# Altium schematic sheet 01_ECG_Input_AFE.SchDoc
size A; SheetNumber: 6; SheetTotal: 6
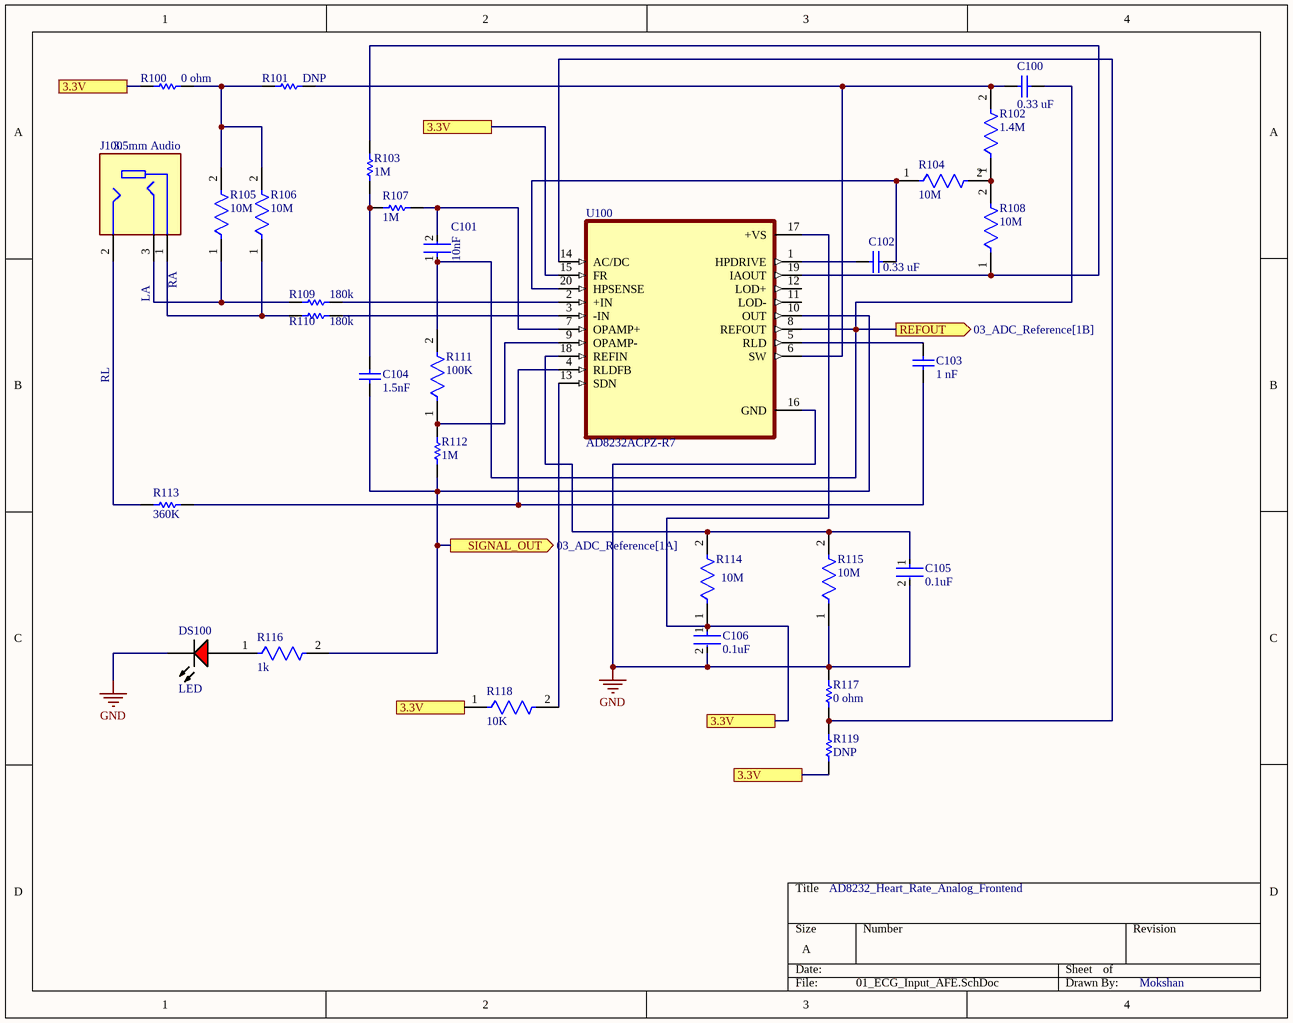
[diagram p0: 01_ECG_Input_AFE.SchDoc]

## Parts
C100  0.33 uF  [CAPC2013X135X45ML10T25]
C101  10nF  [FP-0805-L_2_01_0_2-W_1_25-IPC_A]
C102  0.33 uF  [CAPC2013X135X45ML10T25]
C103  1 nF  [CAPC0805(2012)100_M]
C104  1.5nF  [CAPC2013X140X50ML20T25]
C105  0.1uF  [FP-CC0805-0_85-MFG]
C106  0.1uF  [FP-CC0805-0_85-MFG]
DS100  LED  [LUMX-SML-LX1206IC_V]
J100  3.5mm Audio  [CUI_SJ1-3523N]
R100  0 ohm  [RESC1608X55X25ML10T15]
R101  DNP  [RESC1608X55X25ML10T15]
R102  1.4M  [FP-ESR10-MFG]
R103  1M  [RESC0805(2012)_L]
R104  10M  [FP-CRCW0805-e3-IPC_C]
R105  10M  [FP-CRCW0805-e3-IPC_C]
R106  10M  [FP-CRCW0805-e3-IPC_C]
R107  1M  [RESC0805(2012)_L]
R108  10M  [FP-CRCW0805-e3-IPC_C]
R109  180k  [RESC2013X60X30NL20T20]
R110  180k  [RESC2013X60X30NL20T20]
R111  100K  [FP-CRGCQ0805-IPC_C]
R112  1M  [RESC0805(2012)_L]
R113  360K  [RESC2013X60X30NL20T20]
R114  10M  [FP-CRCW0805-e3-IPC_C]
R115  10M  [FP-CRCW0805-e3-IPC_C]
R116  1k  [FP-MCU0805-IPC_A]
R117  0 ohm  [RESC1608X55X25ML10T15]
R118  10K  [FP-TFCR0805-IPC_C]
R119  DNP  [RESC1608X55X25ML10T15]
U100  AD8232ACPZ-R7  [QFN50P400X400X100-21N]

## Ports
3.3V (see 01_ECG_Input_AFE[1A], 01_ECG_Input_AFE[2A], 01_ECG_Input_AFE[2C], 01_ECG_Input_AFE[3C], 03_ADC_Reference[1B], 03_ADC_Reference[3C], 03_ADC_Reference[3D], 05_Power_Management[4A]), 3.3V (see 01_ECG_Input_AFE[1A], 01_ECG_Input_AFE[2A], 01_ECG_Input_AFE[2C], 01_ECG_Input_AFE[3D], 03_ADC_Reference[1B], 03_ADC_Reference[3C], 03_ADC_Reference[3D], 05_Power_Management[4A]), 3.3V (see 01_ECG_Input_AFE[1A], 01_ECG_Input_AFE[2A], 01_ECG_Input_AFE[3C], 01_ECG_Input_AFE[3D], 03_ADC_Reference[1B], 03_ADC_Reference[3C], 03_ADC_Reference[3D], 05_Power_Management[4A]), 3.3V (see 01_ECG_Input_AFE[1A], 01_ECG_Input_AFE[2C], 01_ECG_Input_AFE[3C], 01_ECG_Input_AFE[3D], 03_ADC_Reference[1B], 03_ADC_Reference[3C], 03_ADC_Reference[3D], 05_Power_Management[4A]), 3.3V (see 01_ECG_Input_AFE[2A], 01_ECG_Input_AFE[2C], 01_ECG_Input_AFE[3C], 01_ECG_Input_AFE[3D], 03_ADC_Reference[1B], 03_ADC_Reference[3C], 03_ADC_Reference[3D], 05_Power_Management[4A]), REFOUT (out, see 03_ADC_Reference[1B]), SIGNAL_OUT (out, see 03_ADC_Reference[1A])

## Nets
GND: C105.2 C106.2 DS100.2(K) R115.1 R117.2 U100.16(GND)
3.3V: C106.1 R100.1 R114.1 R118.1 R119.2 U100.15(FR) U100.17(+VS) ; port 3.3V
REFOUT: C100.2 C101.1 R111.2 U100.8(REFOUT) ; port REFOUT
SIGNAL_OUT: C104.1 R112.1 R116.2 U100.10(OUT) ; port SIGNAL_OUT
NetC100_1: C100.1 R101.2 R102.2 U100.6(SW)
NetC101_2: C101.2 R107.2 U100.7(OPAMP+)
NetC102_1: C102.1 U100.1(HPDRIVE)
NetC102_2: C102.2 R104.1 U100.20(HPSENSE)
NetC103_1: C103.1 R113.2 U100.4(RLDFB)
NetC103_2: C103.2 U100.5(RLD)
NetC104_2: C104.2 R103.1 R107.1
NetC105_1: C105.1 R114.2 R115.2 U100.18(REFIN)
NetDS100_1: DS100.1(A) R116.1
NetJ100_1: J100.1 R106.1 R110.1
NetJ100_2: J100.2 R113.1
NetJ100_3: J100.3 R105.1 R109.1
NetR100_2: R100.2 R101.1 R105.2 R106.2
NetR102_1: R102.1 R104.2 R108.2
NetR103_2: R103.2 R108.1 U100.19(IAOUT)
NetR109_2: R109.2 U100.2(+IN)
NetR110_2: R110.2 U100.3(-IN)
NetR111_1: R111.1 R112.2 U100.9(OPAMP-)
NetR117_1: R117.1 R119.1 U100.14(AC/DC)
NetR118_2: R118.2 U100.13(SDN)

Not connected (* = marked no-connect by the designer): U100 11(LOD-) 12(LOD+)

## Notes on the sheet
- LA
- RA
- RL
- AD8232_Heart_Rate_Analog_Frontend
- Mokshan

## Library data of the parts
C100 C102 = CMP-2007-03570-1: Manufacturer: Murata; Part Number: GRM21BR71E334KA01K
C101 = CMP-04427-005637-1: General Purpose Ceramic Capacitor, 0805, 10nF, 10%, X8R, 15%, 50V; Voltage Rating (DC): 50V; Length: 2.01mm; Case/Package: 0805; REACH SVHC: No SVHC; Series: FlEXITERM; Max Operating Temperature: 150°C; RoHS Compliant: Yes; Termination: SMD/SMT; Tolerance: 10%; Capacitance: 10nF; Voltage: 50V; Height: 0.94mm; Dielectric: X8R; Min Operating Temperature: -55°C; Depth: 1.25mm
C103 = CMP-1036-02962-1: CAP 1nF 16V ±20% 0805 (2012 Metric) Thickness 1mm SMD; Tolerance: Â±20%; Case-Metric: 2012; Case-EIA: 0805; Max Thickness: 1 mm; Technology: SMT; Rated Voltage: 16 V; Value: 1nF
C104 = CMP-2007-04787-1: Part Number: 08055F152KAT2A; Manufacturer: AVX Interconnect / Elco
C105 C106 = CMP-03422-000402-1: CC0805 100 nF X7R 20.00% 16 V; Manufacturer: Yageo; Manufacturer Part Number: CC0805MRX7R7BB104; Voltage Rating: 16 V; Material: Ceramic; Capacitance: 100 nF; Tolerance: 0.2; Value: 100 nF; Temperature: -30°C to +85°C; Category: Cap; ComponentLink2Description: Datasheet; RoHS: TRUE; Footprint Url: http://www.yageo.com/exep/pages/download/literatures/UPY-C_GEN_24.pdf; Lead Free: Yes; Octopart: https://octopart.com/cc0805mrx7r7bb104-yageo-84795387; ComponentLink2URL: http://www.yageo.com/documents/recent/UPY-GPHC_Y5V_6.3V-to-50V_8.pdf; Device Class L2: Capacitors; Ipc Land Pattern Name: CAPC200125X85; Height: 0.95mm; Temperature Range High: +85°C; Device Class L3: Ceramic Capacitors; Temperature Characteristic: X7R; Temperature Range Low: -30°C; Package: CC0805-0.85; Automotive: No; Device Class L1: Passive Components
DS100 = CMP-2000-07123-1: LED Red, 65 mW, -40 to 85 degC, 2-Pin SMD, RoHS, Tape and Reel; Manufacturer: Lumex; Part No: SML-LX1206IC-TR; LED Material: GaAsP; Peak Wavelength: 635nm; Number of LEDs: 1; Viewing Angle: 160; Reverse Voltage: 5(Min)V; Lens Appearance: ColorlessNonDiffused; Intensity: 6mcd; Type: Uni-Color; Pin_Count: 2; Lens Dimensions: 2x1.6x0.5mm; Mounting: SurfaceMount; ECCN: EAR99; RoHS: Unknown; Package Description: 2-Pin Surface Mount Device, Body 3.2 x 1.5 mm; Mounting Technology: SurfaceMount; Dominant Wavelength: N/A; Supplier_Package: SMD; Supplier Standard Pack: 3,000; Color: Red; Dimension: 3.2x1.6x1.1mm; HTS: 8541402000; Family: SML-LX1206IC; Supplier: Lumex; Datasheet URL: http://www.lumex.com/content/files/ProductAttachment/SML-LX1206IC-TR.pdf; Package Reference: SML-LX1206IC; Manufacturer URL: http://www.lumexinstruments.com/; Operating Temperature: -25to85C; Packaging: TapeandReel; Datasheet Version: Rev. J, 08/2012
J100 = SJ1-3523N: 3.5 mm, Stereo, Right Angle, Through Hole, 3 Conductors, 0 Internal Switches, Audio Jack Connector; MF: Same Sky; SnapEDA_Link: https://www.snapeda.com/parts/SJ1-3523N/Same+Sky/view-part/?ref=snap; Package: None; Value: *; MP: SJ1-3523N; Check_prices: https://www.snapeda.com/parts/SJ1-3523N/Same+Sky/view-part/?ref=eda
R100 R101 R117 R119 = CMP-2100-03667-1: Chip Resistor, 0 Ohm, +/- 5%, 0.1 W, -55 to 155 degC, 0603 (1608 Metric), RoHS, Tape and Reel; Manufacturer: Yageo; Temperature Coefficient: 200ppm/degreesC; Voltage Rating: 50V; Power Rating: 100mW; Resistance: 0mOhm; Width: 0.8mm; Max Operating Temperature: 155degC; Tolerance: 5%; Package Reference: 0603; Height: 0.45mm; Depth: 0.8mm; Package Description: 2-Pin Surface Mount Device, Body 1.6 x 0.8 mm; Termination: SMD/SMT; Package Quantity: 5000; Case/Package: 0603; Case Code (Imperial): 0603; Radiation Hardening: No; Number of Pins: 2; Length: 1.6mm; Lead Free: LeadFree; Voltage Rating (DC): 50V; Military Standard: Not; Datasheet URL: http://www.yageo.com/NewPortal/yageodocoutput?fileName=/pdf/R-Chip/PYu-RC_Group_51_RoHS_L_5.pdf; Manufacturer URL: http://www.yageo.com/; Packaging: TapeandReel; Case Code (Metric): 1608; Min Operating Temperature: -55degC; Composition: ThickFilm; RoHSCompliant: true; Contact Plating: Tin; Datasheet Version: Rev. 5, 10/2016; REACH SVHC: NoSVHC
R102 = CMP-08839-004808-1: 1.4MΩ ±1% 0.4W 0805 Anti-Surge Chip Resistor AEC-Q200; Temperature Coefficient: 100ppm/°C; Resistance: 1.4MR; Max Power Dissipation: 400mW; Resistor Type: Thick Film; Width: 0.049inch; Min Operating Temperature: -55°C; Max Operating Temperature: 155°C; Height: 0.026inch; Length: 0.079inch; Package Quantity: 5000; Packaging: Tape and Reel; Features: Automotive AEC-Q200; RoHS Compliant: Yes; Number of Terminations: 2; Case/Package: 0805; Series: ESR10; Tolerance: 1%
R103 R107 R112 = CMP-1013-00146-1: 1M 0.125W 5% 0805 (2012 Metric)  SMD; Case-Metric: 2012; Value: 1000000.00 Ohm; Case-EIA: 0805; Technology: SMT; Tolerance: 5 %; Power: 0.125 W
R104-R106 R108 R114 R115 = CMP-2001-04913-2: RES Thick Film, 10MΩ, 1%, 0.125W, 100ppm/°C, 0805; Power Rating: 125mW; Voltage Rating (DC): 150V; Tolerance: 5%; Resistance: 10MR; Contact Plating: Tin; Composition: Thick Film; Length: 2mm; Weight: 0.000194oz; Case Code (Metric): 2012; Voltage Rating: 150V; Package Quantity: 10; Height: 0.02inch; Case Code (Imperial): 0805; Lead Free: Lead Free; Depth: 1.25mm; Min Operating Temperature: -55°C; Max Power Dissipation: 125mW; Temperature Coefficient: 100ppm/°C; Mount: Surface Mount; Features: Automotive AEC-Q200; Termination: SMD/SMT; Max Operating Temperature: 155°C; Radiation Hardening: No; Case/Package: 0805; Width: 0.049inch; Military Standard: Not; Number of Terminations: 2; Packaging: Tape and Reel
R109 R110 R113 = CMP-2001-04645-1: Manufacturer: KOA Speer; Part Number: RK73B2ATTD364J
R111 = CMP-03211-000816-1: CRGCQ 0805 100K 1%; Manufacturer: TE Connectivity; Manufacturer Part Number: CRGCQ0805F100K; Tolerance: 0.01; Power Rating: 0.125W; Resistance: 100KΩ; Value: 100KΩ; Temperature Coefficient: ±100ppm/°C; Voltage Rating: 150V; RoHS: TRUE; ComponentLink2URL: https://www.te.com/commerce/DocumentDelivery/DDEController?Action=showdoc&DocId=Data+Sheet%7F1773204-3%7F1%7Fpdf%7FEnglish%7FENG_DS_1773204-3_1.pdf%7F4-2176341-1150; Category: Res; Device Class L2: Resistors; Height: 0.65mm; Ambient Temperature Range High: +70°C; Ipc Land Pattern Name: RESC200125X55; Octopart: https://octopart.com/crgcq0805f100k-te+connectivity-91018138; Digikey Description: CRGCQ 0805 100K 1%; Temperature Range High: +155°C; Lead Free: Yes; Automotive: Yes; Temperature Range Low: -55°C; Device Class L1: Passive Components; Device Class L3: Chip SMD Resistors; Mouser Description: Res Thick Film 0805 100K Ohm 1% 0.125W(1/8W) ±100ppm/C Pad SMD Automotive T/R; Temperature: -55°C to +155°C; Composition: Thick Film; ComponentLink2Description: Datasheet; Automotive Grade: Grade 1141; Package: CRGCQ0805; Series: CRGCQ
R116 = CMP-02407-009864-1: RES 1.05K OHM 0.5% 1/5W 0805; Voltage Rating (DC): 100V; Temperature Coefficient: 25ppm/°C; Max Power Dissipation: 125mW; Resistance: 1kR; Tolerance: 0.1%; Radiation Hardening: No; Composition: Thin Film; Height: 0.022inch; Package Quantity: 1000; Length: 0.079inch; Width: 0.049inch; Case/Package: 0805; Number of Terminations: 2; Packaging: Tape and Reel; Depth: 1.25mm; Contact Plating: Tin; Military Standard: Not; Lead Free: Lead Free; Max Operating Temperature: 125°C; Min Operating Temperature: -55°C
R118 = CMP-250906-233618-1: RES Thin Film,  2kΩ, 0.1%, 0.1W, 25ppm/°C, 0805
U100 = AD8232ACPZ-R7: None; MF: {'manufacturer': u'Analog Devices Inc.'}; Package: None; Price: None; Value: *; MP: AD8232ACPZ-R7; Availability: Unavailable